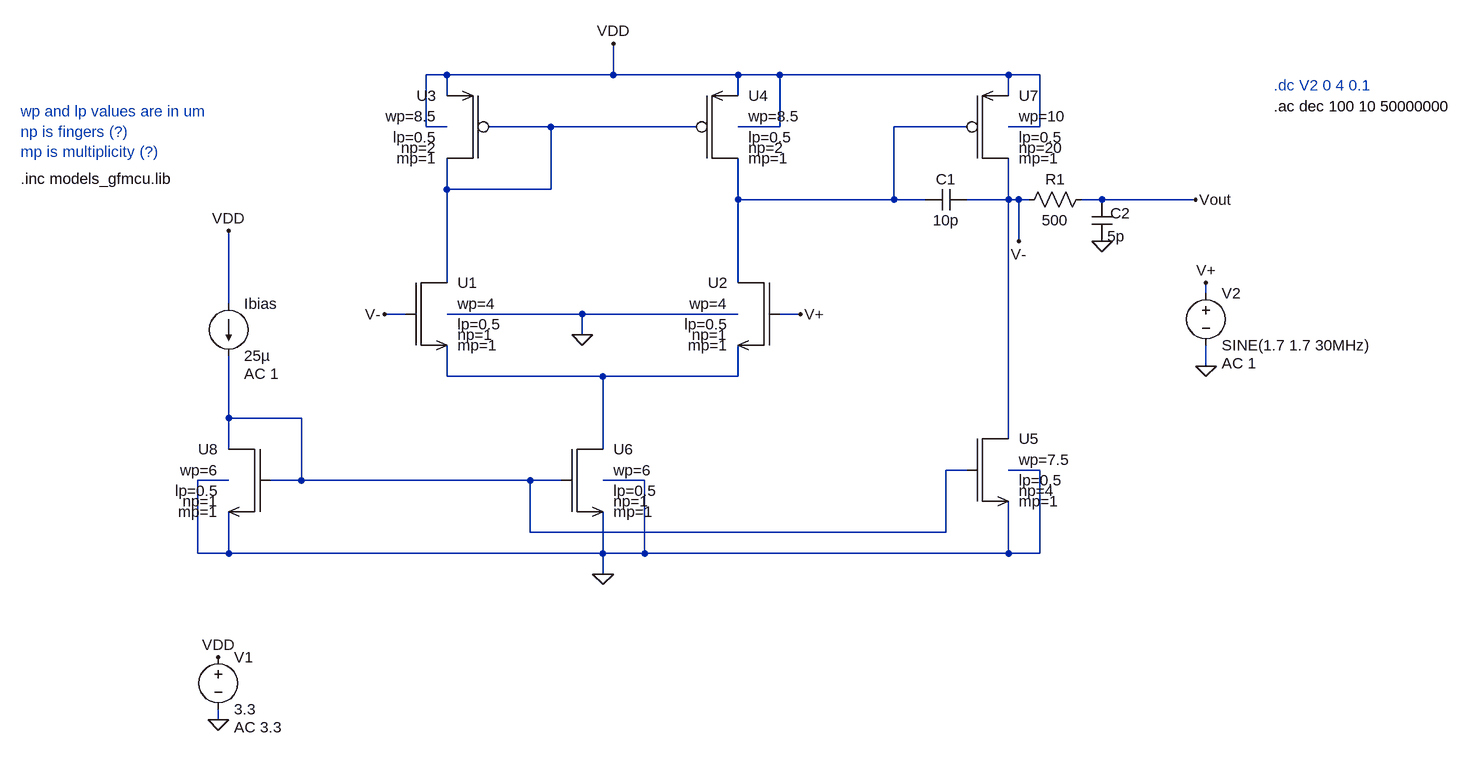
[diagram p0: schematic Bugger.asc]
Bugger.asc, the LTspice schematic file:
Version 4.1
SHEET 1 880 880
WIRE -768 -224 -800 -224
WIRE -512 -224 -512 -272
WIRE -512 -224 -768 -224
WIRE -320 -224 -512 -224
WIRE -256 -224 -320 -224
WIRE 96 -224 -256 -224
WIRE 144 -224 96 -224
WIRE -768 -192 -768 -224
WIRE -320 -192 -320 -224
WIRE 96 -192 96 -224
WIRE -800 -144 -800 -224
WIRE -768 -144 -800 -144
WIRE -608 -144 -704 -144
WIRE -384 -144 -608 -144
WIRE -256 -144 -256 -224
WIRE -256 -144 -320 -144
WIRE 32 -144 -80 -144
WIRE 144 -144 144 -224
WIRE 144 -144 96 -144
WIRE -768 -48 -768 -96
WIRE -608 -48 -608 -144
WIRE -608 -48 -768 -48
WIRE -320 -32 -320 -96
WIRE -80 -32 -80 -144
WIRE -80 -32 -320 -32
WIRE -32 -32 -80 -32
WIRE 96 -32 96 -96
WIRE 96 -32 32 -32
WIRE 112 -32 96 -32
WIRE 128 -32 112 -32
WIRE 240 -32 208 -32
WIRE 384 -32 240 -32
WIRE 112 32 112 -32
WIRE -768 96 -768 -48
WIRE -320 96 -320 -32
WIRE 400 112 400 96
WIRE -1104 128 -1104 16
WIRE -832 144 -864 144
WIRE -560 144 -768 144
WIRE -320 144 -560 144
WIRE -224 144 -256 144
WIRE -560 176 -560 144
WIRE 400 224 400 192
WIRE -768 240 -768 192
WIRE -528 240 -768 240
WIRE -320 240 -320 192
WIRE -320 240 -528 240
WIRE -1104 304 -1104 208
WIRE -992 304 -1104 304
WIRE 96 336 96 -32
WIRE -1104 352 -1104 304
WIRE -528 352 -528 240
WIRE 32 384 0 384
WIRE 144 384 96 384
WIRE -1104 400 -1152 400
WIRE -992 400 -992 304
WIRE -992 400 -1040 400
WIRE -640 400 -992 400
WIRE -592 400 -640 400
WIRE -464 400 -528 400
WIRE -640 480 -640 400
WIRE 0 480 0 384
WIRE 0 480 -640 480
WIRE -1152 512 -1152 400
WIRE -1104 512 -1104 448
WIRE -1104 512 -1152 512
WIRE -528 512 -528 448
WIRE -528 512 -1104 512
WIRE -464 512 -464 400
WIRE -464 512 -528 512
WIRE 96 512 96 432
WIRE 96 512 -464 512
WIRE 144 512 144 384
WIRE 144 512 96 512
WIRE -528 544 -528 512
WIRE -1120 768 -1120 752
FLAG -512 -272 VDD
FLAG -1104 16 VDD
FLAG -864 144 V-
FLAG -224 144 V+
FLAG -1120 768 0
FLAG -1120 672 VDD
FLAG 400 96 V+
FLAG 112 32 V-
FLAG 400 224 0
FLAG -560 176 0
FLAG -528 544 0
FLAG 384 -32 Vout
FLAG 240 32 0
SYMBOL LTS_GFMCU\\gfmcu_nmos3p3 -832 144 R0
SYMATTR Value wp=4
SYMATTR InstName U1
SYMATTR Value2 lp=0.5
SYMBOL LTS_GFMCU\\gfmcu_nmos3p3 -256 144 M0
SYMATTR Value wp=4
SYMATTR InstName U2
SYMATTR Value2 lp=0.5
SYMBOL LTS_GFMCU\\gfmcu_pmos3p3 -704 -144 M0
SYMATTR Value wp=8.5
SYMATTR InstName U3
SYMATTR Value2 lp=0.5
SYMATTR SpiceLine np=2
SYMBOL LTS_GFMCU\\gfmcu_pmos3p3 -384 -144 R0
SYMATTR Value wp=8.5
SYMATTR InstName U4
SYMATTR Value2 lp=0.5
SYMATTR SpiceLine np=2
SYMBOL LTS_GFMCU\\gfmcu_pmos3p3 32 -144 R0
SYMATTR Value wp=10
SYMATTR InstName U7
SYMATTR Value2 lp=0.5
SYMATTR SpiceLine np=20
SYMBOL LTS_GFMCU\\gfmcu_nmos3p3 32 384 R0
SYMATTR Value wp=7.5
SYMATTR InstName U5
SYMATTR Value2 lp=0.5
SYMATTR SpiceLine np=4
SYMBOL LTS_GFMCU\\gfmcu_nmos3p3 -592 400 R0
SYMATTR Value wp=6
SYMATTR InstName U6
SYMATTR Value2 lp=0.5
SYMBOL LTS_GFMCU\\gfmcu_nmos3p3 -1040 400 M0
SYMATTR Value wp=6
SYMATTR InstName U8
SYMATTR Value2 lp=0.5
SYMBOL cap 32 -48 R90
WINDOW 0 0 32 VBottom 2
WINDOW 3 32 32 VTop 2
SYMATTR InstName C1
SYMATTR Value 10p
SYMBOL current -1104 128 R0
WINDOW 123 24 108 Left 2
WINDOW 39 0 0 Left 0
SYMATTR Value2 AC 1
SYMATTR InstName Ibias
SYMATTR Value 25µ
SYMBOL voltage -1120 656 R0
WINDOW 123 24 124 Left 2
WINDOW 39 0 0 Left 0
SYMATTR Value2 AC 3.3
SYMATTR InstName V1
SYMATTR Value 3.3
SYMBOL voltage 400 96 R0
WINDOW 123 24 124 Left 2
WINDOW 39 0 0 Left 0
SYMATTR Value2 AC 1
SYMATTR InstName V2
SYMATTR Value SINE(1.7 1.7 30MHz)
SYMBOL cap 224 -32 R0
WINDOW 0 29 21 Left 2
SYMATTR InstName C2
SYMATTR Value 5p
SYMBOL res 224 -48 R90
WINDOW 0 0 56 VBottom 2
WINDOW 3 32 56 VTop 2
SYMATTR InstName R1
SYMATTR Value 500
TEXT -1424 -64 Left 2 !.inc models_gfmcu.lib
TEXT 504 -208 Left 2 ;.dc V2 0 4 0.1
TEXT -1424 -168 Left 2 ;wp and lp values are in um\nnp is fingers (?)\nmp is multiplicity (?)
TEXT 504 -176 Left 2 !.ac dec 100 10 50000000

The netlist it stands for:
* Bugger.asc
X§U1 N001 V- N003 0 gfmcu_nmos3p3 wp=4 lp=0.5 np=1 mp=1  ; pins ND NG NS NB
X§U2 N002 V+ N003 0 gfmcu_nmos3p3 wp=4 lp=0.5 np=1 mp=1  ; pins ND NG NS NB
X§U3 N001 N001 VDD VDD gfmcu_pmos3p3 wp=8.5 lp=0.5 np=2 mp=1  ; pins ND NG NS NB
X§U4 N002 N001 VDD VDD gfmcu_pmos3p3 wp=8.5 lp=0.5 np=2 mp=1  ; pins ND NG NS NB
X§U7 V- N002 VDD VDD gfmcu_pmos3p3 wp=10 lp=0.5 np=20 mp=1  ; pins ND NG NS NB
X§U5 V- N004 0 0 gfmcu_nmos3p3 wp=7.5 lp=0.5 np=4 mp=1  ; pins ND NG NS NB
X§U6 N003 N004 0 0 gfmcu_nmos3p3 wp=6 lp=0.5 np=1 mp=1  ; pins ND NG NS NB
X§U8 N004 N004 0 0 gfmcu_nmos3p3 wp=6 lp=0.5 np=1 mp=1  ; pins ND NG NS NB
C1 V- N002 10p
Ibias VDD N004 25µ AC 1
V1 VDD 0 3.3 AC 3.3
V2 V+ 0 SINE(1.7 1.7 30MHz) AC 1
C2 Vout 0 5p
R1 Vout V- 500
.inc models_gfmcu.lib
* .dc V2 0 4 0.1
* wp and lp values are in um
* np is fingers (?)
* mp is multiplicity (?)
.ac dec 100 10 50000000
.lib models_gfmcu.lib
.backanno
.end